# Altium schematic sheet speed-and-rpm-analog.SchDoc
size A4; SheetNumber: 10; SheetTotal: 15
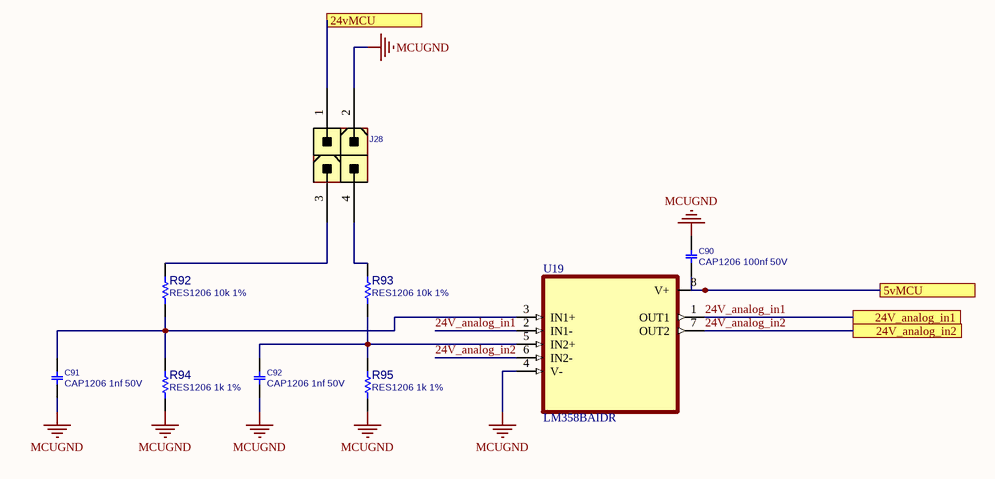
[diagram p0: speed-and-rpm-analog.SchDoc]

## Parts
C90  CAP1206 100nf 50V  [C1206]
C91  CAP1206 1nf 50V  [C1206]
C92  CAP1206 1nf 50V  [C1206]
J28  CONN_ATXPWR_4  [ATXPWR_4]  (value not drawn)
R92  RES1206 10k 1%  [R1206]
R93  RES1206 10k 1%  [R1206]
R94  RES1206 1k 1%  [R1206]
R95  RES1206 1k 1%  [R1206]
U19  LM358BAIDR  [SOIC127P599X175-8N]

## Ports
5vMCU, 24V_analog_in1, 24V_analog_in2, 24vMCU

## Nets
MCUGND: C90.1 C91.2 C92.2 J28.2 R94.2 R95.2 U19.4(V-)
5vMCU: C90.2 U19.8(V+) ; port 5vMCU
24V_analog_in1: U19.1(OUT1) U19.2(IN1-) ; port 24V_analog_in1
24V_analog_in2: U19.6(IN2-) U19.7(OUT2) ; port 24V_analog_in2
24vMCU: J28.1 ; port 24vMCU
NetC91_1: C91.1 R92.2 R94.1 U19.3(IN1+)
NetC92_1: C92.1 R93.2 R95.1 U19.5(IN2+)
NetJ28_3: J28.3 R92.1
NetJ28_4: J28.4 R93.1

## Library data of the parts
C90-C92 = CAP_SMD_MLCC_1206: CAP, MLCC; PARAM: -, -%; MANF_P#: MANF_PART#; PARAM2: -V; PRICE: 100= 1$; MANF: -; ASSEMBLY: ASSEMBLY
J28 = CONN_ATXPWR_4: CONN, ATX POWER, 4 P; MANF: TE, Molex; MANF_P#: 4-1775099-0, 39281043; VALUE: CONN_ATXPWR_4; MountType: THD; PACKAGE: ATXPWR-4pin; Part Type: Conn.
R92-R95 = RES_SMD_1206: RESISTOR, SMD; PARAM: 1%, 0.25W; DESC: DESCRIPTION; DIST#: MOUSER; MANF_P#: -; MANF: -; ASSEMBLY: ASSEMBLY; PRICE: -; PARAM2: -
U19 = LM358BAIDR: Dual, 36-V, 1.2-MHz, 2-mV offset voltage operational amplifier; MF: Texas Instruments; SnapEDA_Link: https://www.snapeda.com/parts/LM358BAIDR/Texas+Instruments/view-part/?ref=snap; Package: SOIC-8 Texas Instruments; Value: *; MP: LM358BAIDR; Check_prices: https://www.snapeda.com/parts/LM358BAIDR/Texas+Instruments/view-part/?ref=eda